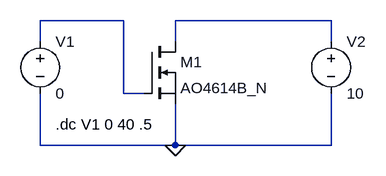
[diagram p0: schematic 1.asc]
1.asc, the LTspice schematic file:
Version 4.1
SHEET 1 880 680
WIRE 128 0 0 0
WIRE 448 0 208 0
WIRE 0 32 0 0
WIRE 208 32 208 0
WIRE 448 32 448 0
WIRE 128 112 128 0
WIRE 160 112 128 112
WIRE 0 192 0 112
WIRE 208 192 208 128
WIRE 208 192 0 192
WIRE 448 192 448 112
WIRE 448 192 208 192
FLAG 208 192 0
SYMBOL nmos 160 32 R0
SYMATTR InstName M1
SYMATTR Value AO4614B_N
SYMBOL voltage 0 16 R0
WINDOW 123 0 0 Left 0
WINDOW 39 0 0 Left 0
SYMATTR InstName V1
SYMATTR Value 0
SYMBOL voltage 448 16 R0
WINDOW 123 0 0 Left 0
WINDOW 39 0 0 Left 0
SYMATTR InstName V2
SYMATTR Value 10
TEXT 24 160 Left 2 !.dc V1 0 40 .5

The netlist it stands for:
* 1.asc
M1 N002 N001 0 0 AO4614B_N
V1 N001 0 0
V2 N002 0 10
.model NMOS NMOS
.model PMOS PMOS
.lib standard.mos
.dc V1 0 40 .5
.backanno
.end